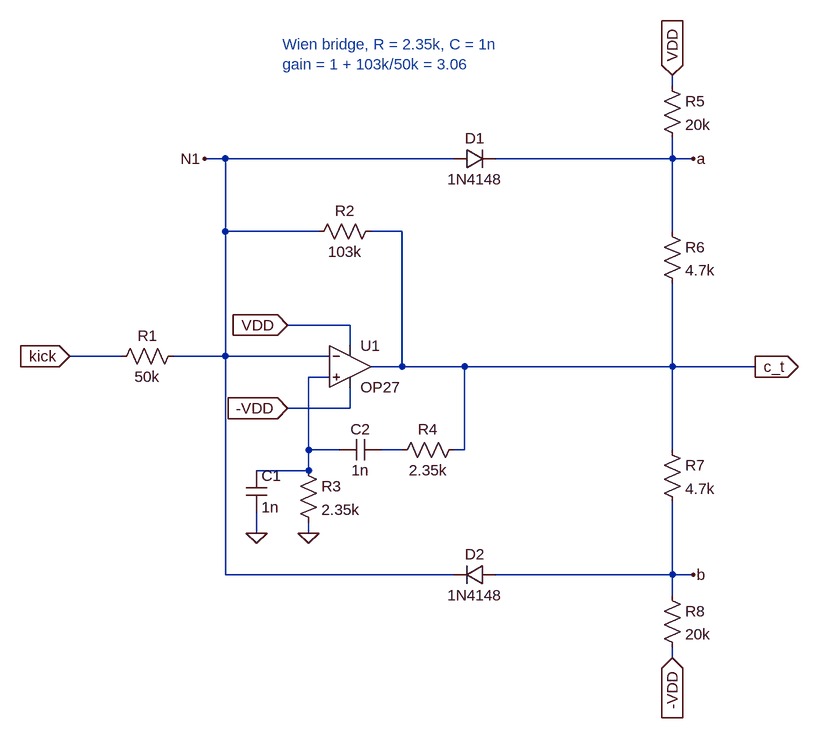
[diagram p0: schematic Oscillator.asc]
Oscillator.asc, the LTspice schematic file:
Version 4.1
SHEET 1 1652 1700
WIRE -1840 560 -1840 544
WIRE -2528 672 -2560 672
WIRE -2176 672 -2528 672
WIRE -1840 672 -1840 640
WIRE -1840 672 -2112 672
WIRE -1808 672 -1840 672
WIRE -2528 784 -2528 672
WIRE -2384 784 -2528 784
WIRE -2256 784 -2304 784
WIRE -1840 784 -1840 672
WIRE -2336 928 -2432 928
WIRE -2336 960 -2336 928
WIRE -2688 976 -2768 976
WIRE -2528 976 -2528 784
WIRE -2528 976 -2608 976
WIRE -2368 976 -2528 976
WIRE -2256 992 -2256 784
WIRE -2256 992 -2304 992
WIRE -2160 992 -2256 992
WIRE -1840 992 -1840 864
WIRE -1840 992 -2160 992
WIRE -1712 992 -1840 992
WIRE -2368 1008 -2400 1008
WIRE -2336 1056 -2336 1024
WIRE -2336 1056 -2432 1056
WIRE -2400 1120 -2400 1008
WIRE -2352 1120 -2400 1120
WIRE -2256 1120 -2288 1120
WIRE -2160 1120 -2160 992
WIRE -2160 1120 -2176 1120
WIRE -1840 1120 -1840 992
WIRE -2400 1152 -2400 1120
WIRE -2400 1152 -2480 1152
WIRE -2480 1248 -2480 1216
WIRE -2400 1248 -2400 1232
WIRE -2528 1312 -2528 976
WIRE -2176 1312 -2528 1312
WIRE -1840 1312 -1840 1200
WIRE -1840 1312 -2112 1312
WIRE -1808 1312 -1840 1312
WIRE -1840 1344 -1840 1312
WIRE -1840 1440 -1840 1424
FLAG -1840 544 VDD
IOPIN -1840 544 In
FLAG -1840 1440 -VDD
IOPIN -1840 1440 In
FLAG -2432 928 VDD
IOPIN -2432 928 In
FLAG -2432 1056 -VDD
IOPIN -2432 1056 In
FLAG -2560 672 N1
FLAG -1808 672 a
FLAG -1808 1312 b
FLAG -1712 992 c_t
IOPIN -1712 992 Out
FLAG -2480 1248 0
FLAG -2400 1248 0
FLAG -2768 976 kick
IOPIN -2768 976 In
SYMBOL diode -2176 688 R270
WINDOW 0 32 32 VTop 2
WINDOW 3 0 32 VBottom 2
SYMATTR InstName D1
SYMATTR Value 1N4148
SYMBOL OpAmps\\OP27 -2336 928 R0
SYMATTR InstName U1
SYMBOL res -2288 768 R90
WINDOW 0 0 56 VBottom 2
WINDOW 3 32 56 VTop 2
SYMATTR InstName R2
SYMATTR Value 103k
SYMBOL res -2592 960 R90
WINDOW 0 0 56 VBottom 2
WINDOW 3 32 56 VTop 2
SYMATTR InstName R1
SYMATTR Value 50k
SYMBOL cap -2496 1152 R0
SYMATTR InstName C1
SYMATTR Value 1n
SYMBOL res -2416 1136 R0
SYMATTR InstName R3
SYMATTR Value 2.35k
SYMBOL cap -2288 1104 R90
WINDOW 0 0 32 VBottom 2
WINDOW 3 32 32 VTop 2
SYMATTR InstName C2
SYMATTR Value 1n
SYMBOL res -2160 1104 R90
WINDOW 0 0 56 VBottom 2
WINDOW 3 32 56 VTop 2
SYMATTR InstName R4
SYMATTR Value 2.35k
SYMBOL diode -2112 1296 R90
WINDOW 0 0 32 VBottom 2
WINDOW 3 32 32 VTop 2
SYMATTR InstName D2
SYMATTR Value 1N4148
SYMBOL res -1856 544 R0
SYMATTR InstName R5
SYMATTR Value 20k
SYMBOL res -1856 768 R0
SYMATTR InstName R6
SYMATTR Value 4.7k
SYMBOL res -1856 1104 R0
SYMATTR InstName R7
SYMATTR Value 4.7k
SYMBOL res -1856 1328 R0
SYMATTR InstName R8
SYMATTR Value 20k
TEXT -2440 496 Left 2 ;Wien bridge, R = 2.35k, C = 1n\ngain = 1 + 103k/50k = 3.06

The netlist it stands for:
* Oscillator.asc
D1 N1 a 1N4148
X§U1 N001 N1 VDD -VDD c_t OP27  ; pins In+ In- V+ V- OUT
R2 c_t N1 103k
R1 N1 kick 50k
C1 N001 0 1n
R3 N001 0 2.35k
C2 N002 N001 1n
R4 c_t N002 2.35k
D2 b N1 1N4148
R5 VDD a 20k
R6 a c_t 4.7k
R7 c_t b 4.7k
R8 b -VDD 20k
.model D D
.lib standard.dio
* Wien bridge, R = 2.35k, C = 1n
* gain = 1 + 103k/50k = 3.06
.lib ADI.lib
.backanno
.end